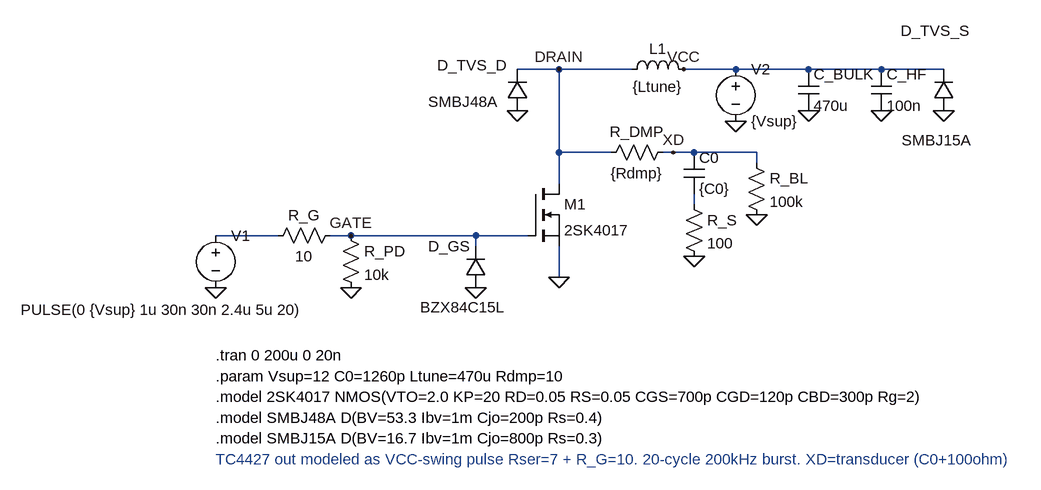
[diagram p0: schematic TX_improved.asc]
TX_improved.asc, the LTspice schematic file:
Version 4.1
SHEET 1 1200 800
WIRE 48 -16 -16 -16
WIRE 160 -16 48 -16
WIRE 320 -16 240 -16
WIRE 432 -16 320 -16
WIRE 544 -16 432 -16
WIRE 640 -16 544 -16
WIRE 48 112 48 -16
WIRE 128 112 48 112
WIRE 224 112 208 112
WIRE 256 112 224 112
WIRE 352 112 256 112
WIRE 352 128 352 112
WIRE 48 160 48 112
WIRE 256 192 256 176
WIRE -384 240 -480 240
WIRE -272 240 -304 240
WIRE -80 240 -272 240
WIRE 0 240 -80 240
WIRE -80 256 -80 240
WIRE 48 304 48 256
FLAG -480 320 0
FLAG -272 320 0
FLAG -80 320 0
FLAG 48 304 0
FLAG 320 64 0
FLAG 432 48 0
FLAG 544 48 0
FLAG 640 48 0
FLAG -16 48 0
FLAG 256 272 0
FLAG 352 208 0
FLAG -272 240 GATE
FLAG 48 -16 DRAIN
FLAG 224 112 XD
FLAG 240 -16 VCC
SYMBOL voltage -480 224 R0
WINDOW 3 -300 130 Left 2
SYMATTR Value PULSE(0 {Vsup} 1u 30n 30n 2.4u 5u 20)
SYMATTR SpiceLine Rser=7
SYMATTR InstName V1
SYMBOL res -288 224 R90
WINDOW 0 0 56 VBottom 2
WINDOW 3 32 56 VTop 2
SYMATTR InstName R_G
SYMATTR Value 10
SYMBOL res -288 224 R0
SYMATTR InstName R_PD
SYMATTR Value 10k
SYMBOL diode -64 320 R180
WINDOW 0 24 64 Left 2
WINDOW 3 -30 -30 Left 2
SYMATTR InstName D_GS
SYMATTR Value BZX84C15L
SYMBOL nmos 0 160 R0
SYMATTR InstName M1
SYMATTR Value 2SK4017
SYMBOL ind 144 0 R270
WINDOW 0 32 56 VTop 2
WINDOW 3 5 56 VBottom 2
SYMATTR InstName L1
SYMATTR Value {Ltune}
SYMATTR SpiceLine Rser=2
SYMBOL voltage 320 -32 R0
SYMATTR InstName V2
SYMATTR Value {Vsup}
SYMBOL cap 416 -16 R0
SYMATTR InstName C_BULK
SYMATTR Value 470u
SYMATTR SpiceLine Rser=0.06
SYMBOL cap 528 -16 R0
SYMATTR InstName C_HF
SYMATTR Value 100n
SYMBOL diode 656 48 R180
WINDOW 0 -24 123 Left 2
WINDOW 3 -26 -45 Left 2
SYMATTR InstName D_TVS_S
SYMATTR Value SMBJ15A
SYMBOL diode 0 48 R180
WINDOW 0 31 70 Left 2
WINDOW 3 47 14 Left 2
SYMATTR InstName D_TVS_D
SYMATTR Value SMBJ48A
SYMBOL res 224 96 R90
WINDOW 0 0 56 VBottom 2
WINDOW 3 32 56 VTop 2
SYMATTR InstName R_DMP
SYMATTR Value {Rdmp}
SYMBOL cap 240 112 R0
SYMATTR InstName C0
SYMATTR Value {C0}
SYMBOL res 240 176 R0
SYMATTR InstName R_S
SYMATTR Value 100
SYMBOL res 336 112 R0
SYMATTR InstName R_BL
SYMATTR Value 100k
TEXT -480 424 Left 2 !.tran 0 200u 0 20n
TEXT -480 456 Left 2 !.param Vsup=12 C0=1260p Ltune=470u Rdmp=10
TEXT -480 488 Left 2 !.model 2SK4017 NMOS(VTO=2.0 KP=20 RD=0.05 RS=0.05 CGS=700p CGD=120p CBD=300p Rg=2)
TEXT -480 520 Left 2 !.model SMBJ48A D(BV=53.3 Ibv=1m Cjo=200p Rs=0.4)
TEXT -480 552 Left 2 !.model SMBJ15A D(BV=16.7 Ibv=1m Cjo=800p Rs=0.3)
TEXT -480 584 Left 2 ;TC4427 out modeled as VCC-swing pulse Rser=7 + R_G=10. 20-cycle 200kHz burst. XD=transducer (C0+100ohm)

The netlist it stands for:
* TX_improved.asc
V1 N002 0 PULSE(0 {Vsup} 1u 30n 30n 2.4u 5u 20) Rser=7
R_G GATE N002 10
R_PD GATE 0 10k
D_GS 0 GATE BZX84C15L
M1 DRAIN GATE 0 0 2SK4017
L1 DRAIN VCC {Ltune} Rser=2
V2 VCC 0 {Vsup}
C_BULK VCC 0 470u Rser=0.06
C_HF VCC 0 100n
D_TVS_S 0 VCC SMBJ15A
D_TVS_D 0 DRAIN SMBJ48A
R_DMP XD DRAIN {Rdmp}
C0 XD N001 {C0}
R_S N001 0 100
R_BL XD 0 100k
.model D D
.lib standard.dio
.model NMOS NMOS
.model PMOS PMOS
.lib standard.mos
.tran 0 200u 0 20n
.param Vsup=12 C0=1260p Ltune=470u Rdmp=10
.model 2SK4017 NMOS(VTO=2.0 KP=20 RD=0.05 RS=0.05 CGS=700p CGD=120p CBD=300p Rg=2)
.model SMBJ48A D(BV=53.3 Ibv=1m Cjo=200p Rs=0.4)
.model SMBJ15A D(BV=16.7 Ibv=1m Cjo=800p Rs=0.3)
* TC4427 out modeled as VCC-swing pulse Rser=7 + R_G=10. 20-cycle 200kHz burst. XD=transducer (C0+100ohm)
.backanno
.end